# Altium project PI - Power.PrjPcb
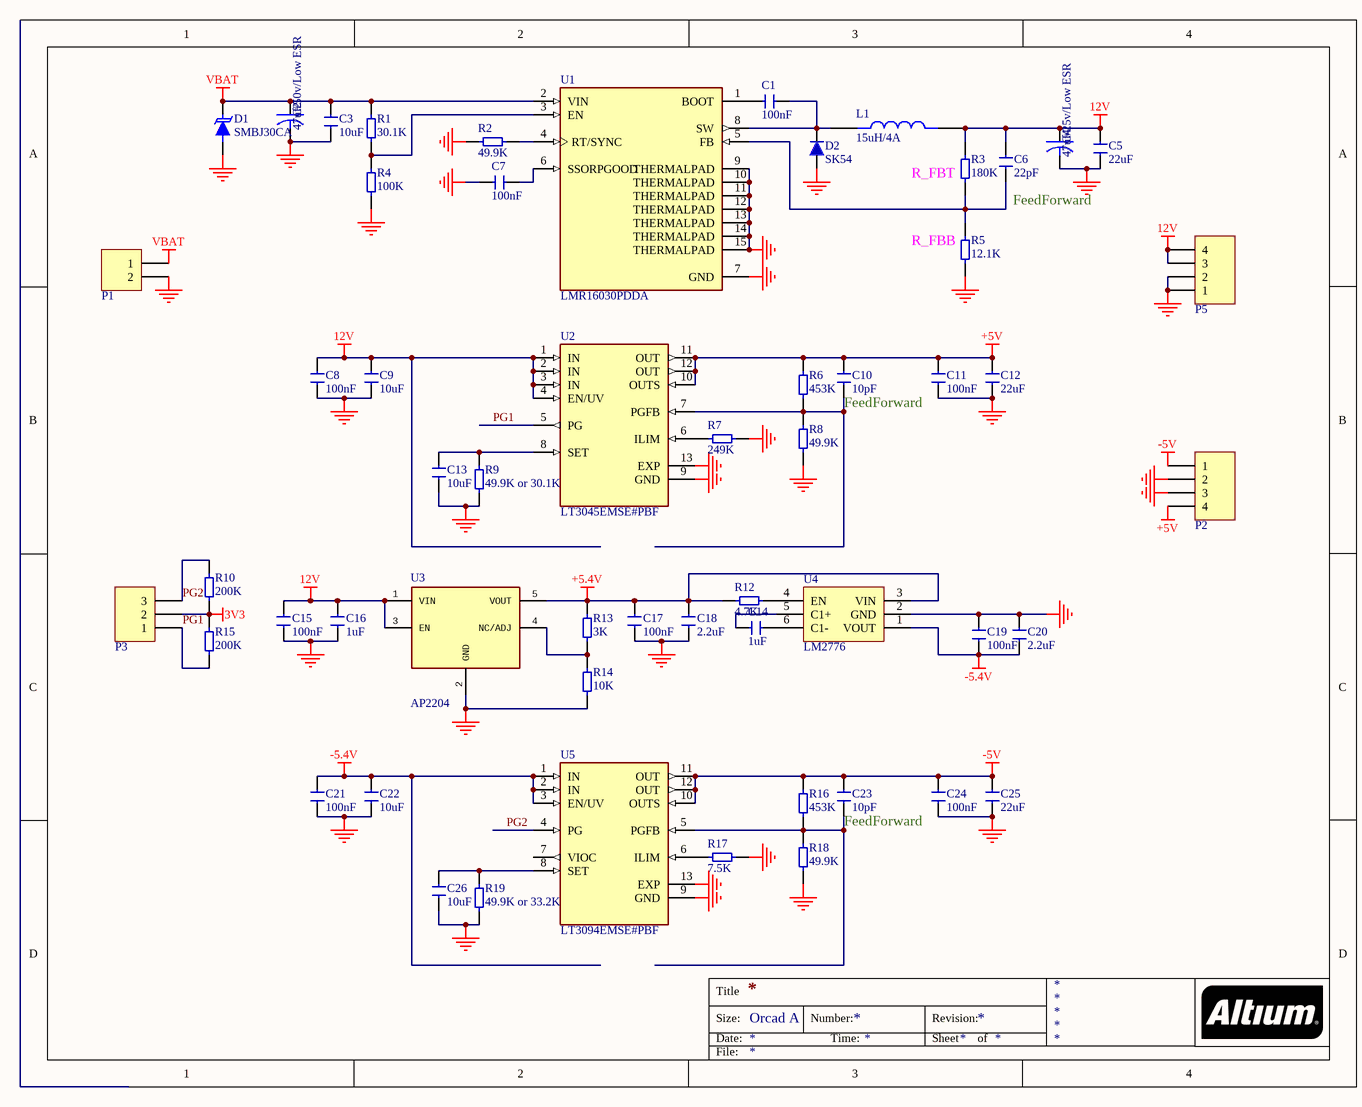
[diagram p0: Power2-5V.SchDoc]
1 sheet, 56 parts. Net scope: global (net labels, ports and power ports of the same name join across sheets).
Board file: PCB3+.PcbDoc

## Sheet Power2-5V.SchDoc
size OrCAD A

### Parts
C1  100nF  [0805 Capacitor]
C2  47uf/50v/Low ESR  [$CAP-RB-80MIL-D5MM]
C3  10uF  [1206 Capacitor]
C4  47uf/25v/Low ESR  [$CAP-RB-80MIL-D5MM]
C5  22uF  [1206 Capacitor]
C6  22pF  [0603 Capacitor]
C7  100nF  [0805 Capacitor]
C8  100nF  [0805 Capacitor]
C9  10uF  [1206 Capacitor]
C10  10pF  [0603 Capacitor]
C11  100nF  [0805 Capacitor]
C12  22uF  [1206 Capacitor]
C13  10uF  [1206 Capacitor]
C14  1uF  [1206 Capacitor]
C15  100nF  [0805 Capacitor]
C16  1uF  [1206 Capacitor]
C17  100nF  [0805 Capacitor]
C18  2.2uF  [1206 Capacitor]
C19  100nF  [0805 Capacitor]
C20  2.2uF  [1206 Capacitor]
C21  100nF  [0805 Capacitor]
C22  10uF  [1206 Capacitor]
C23  10pF  [0603 Capacitor]
C24  100nF  [0805 Capacitor]
C25  22uF  [1206 Capacitor]
C26  10uF  [1206 Capacitor]
D1  SMBJ30CA  [DO-214AC(SMA)]
D2  SK54  [DO-214AC(SMA)]
L1  15uH/4A  [IND_B82477R4103M100]
P1  J2  [$xh-2pin male-L]  (value not drawn)
P2  J4  [$xh-4pin male-L]  (value not drawn)
P3  J3  [$xh-3pin male-L]  (value not drawn)
P5  J4  [$xh-4pin male-L]  (value not drawn)
R1  30.1K  [0805 Resistor]
R2  49.9K  [0805 Resistor]
R3  180K  [0805 Resistor]
R4  100K  [0805 Resistor]
R5  12.1K  [0805 Resistor]
R6  453K  [0805 Resistor]
R7  249K  [0805 Resistor]
R8  49.9K  [0805 Resistor]
R9  49.9K or 30.1K  [0805 Resistor]
R10  200K  [0805 Resistor]
R12  4.7K  [0805 Resistor]
R13  3K  [0805 Resistor]
R14  10K  [0805 Resistor]
R15  200K  [0805 Resistor]
R16  453K  [0805 Resistor]
R17  7.5K  [0805 Resistor]
R18  49.9K  [0805 Resistor]
R19  49.9K or 33.2K  [0805 Resistor]
U1  LMR16030PDDA  [VREG_LMR16030PDDA]
U2  LT3045EMSE#PBF  [SOP65P490X110-13N]
U3  AP2204  [SOT23-5]
U4  LM2776  [SOT23-6]
U5  LT3094EMSE#PBF  [SOP65P490X110-13N]

### Nets
3V3: P3.2 R10.2 R15.1
12V: C4.1 C5.2 C6.1 C8.2 C9.2 C15.2 C16.2 L1.2 P5.3 P5.4 R3.1 U2.1(IN) U2.2(IN) U2.3(IN) U2.4(EN/UV) U3.1(VIN) U3.3(EN)
+5.4V: C17.2 C18.2 R12.1 R13.1 U3.5(VOUT) U4.3(VIN)
+5V: C10.1 C11.2 C12.2 P2.4 R6.1 U2.10(OUTS) U2.11(OUT) U2.12(OUT)
-5.4V: C19.1 C20.1 C21.2 C22.2 U4.1(VOUT) U5.1(IN) U5.2(IN) U5.3(EN/UV)
-5V: C23.1 C24.2 C25.2 P2.1 R16.1 U5.10(OUTS) U5.11(OUT) U5.12(OUT)
GND: C2.2 C3.1 C4.2 C5.1 C7.1 C8.1 C9.1 C11.1 C12.1 C13.1 C15.1 C16.1 C17.1 C18.1 C19.2 C20.2 C21.1 C22.1 C24.1 C25.1 C26.1 D1.1 D2.1(A) P1.2 P2.2 P2.3 P5.1 P5.2 R2.2 R4.1 R5.2 R7.2 R8.2 R9.2 R14.2 R17.2 R18.2 R19.2 U1.7(GND) U1.9(THERMALPAD) U1.10(THERMALPAD) U1.11(THERMALPAD) U1.12(THERMALPAD) U1.13(THERMALPAD) U1.14(THERMALPAD) U1.15(THERMALPAD) U2.9(GND) U2.13(EXP) U3.2(GND) U4.2(GND) U5.9(GND) U5.13(EXP)
VBAT: C2.1 C3.2 D1.2 P1.1 R1.2 U1.2(VIN)
PG1: P3.1 R15.2 U2.5(PG)
PG2: P3.3 R10.1 U5.4(PG)
NetC1_1: C1.1 U1.1(BOOT)
NetC1_2: C1.2 D2.2(K) L1.1 U1.8(SW)
NetC6_2: C6.2 R3.2 R5.1 U1.5(FB)
NetC7_2: C7.2 U1.6(SSORPGOOD)
NetC10_2: C10.2 R6.2 R8.1 U2.7(PGFB)
NetC13_2: C13.2 R9.1 U2.8(SET)
NetC14_1: C14.1 U4.6(C1-)
NetC14_2: C14.2 U4.5(C1+)
NetC23_2: C23.2 R16.2 R18.1 U5.5(PGFB)
NetC26_2: C26.2 R19.1 U5.8(SET)
NetR1_1: R1.1 R4.2 U1.3(EN)
NetR2_1: R2.1 U1.4(RT/SYNC)
NetR7_1: R7.1 U2.6(ILIM)
NetR12_2: R12.2 U4.4(EN)
NetR13_2: R13.2 R14.1 U3.4(NC/ADJ)
NetR17_1: R17.1 U5.6(ILIM)

Not connected (* = marked no-connect by the designer): U5 7(VIOC)

### Notes on the sheet
- (near R3) R_FBT
- FeedForward
- (near R5) R_FBB
- Title
- Size:
- Date:
- Orcad A
- Number:
- Time:
- Revision:
- Sheet
- of
- File:
- (in symbol Cap pol$) +

### Library data of the parts
C1 C3 C5-C26 = Capacitor SMD
  C1 C7 C8 C11 C15 C17 C19 C21 C24: Value: 100nF
  C3 C9 C13 C22 C26: Value: 10uF
  C5 C12 C25: Value: 22uF
  C6: Value: 22pF
  C10 C23: Value: 10pF
  C14 C16: Value: 1uF
  C18 C20: Value: 2.2uF
C2 C4 = Cap pol$: Device Code: 124112
D1 = SMBJ18A-13-F
D2 = 1N4001
L1 = B82477R4103M100: Inductor de Potencia SMD 10 ÂµH 6.2 A Â±20 % 12.5x12.5x8.5 Injection molded base shielded EPCOS / TDK; SnapEDA_Link: https://www.snapeda.com/parts/B82477R4103M100/EPCOS/view-part/?ref=snap; Package: NON STANDARD-2 EPCOS; Value: *; MF: EPCOS; MP: B82477R4103M100; Check_prices: https://www.snapeda.com/parts/B82477R4103M100/EPCOS/view-part/?ref=eda
P1 = Connector2$: Connector, 2Pin; Device Code: 1111111
P2 P5 = Connector4$: Connector, 4Pin; Device Code: 1111111
P3 = Connector3$: Connector, 3Pin; Device Code: 1111111
R1-R10 R12-R19 = Resistor SMD
  R1: Value: 30.1K
  R2 R8 R18: Value: 49.9K
  R3: Value: 180K
  R4: Value: 100K
  R5: Value: 12.1K
  R6 R16: Value: 453K
  R7: Value: 249K
  R9: Value: 49.9K or 30.1K
  R10 R15: Value: 200K
  R12: Value: 4.7K
  R13: Value: 3K
  R14: Value: 10K
  R17: Value: 7.5K
  R19: Value: 49.9K or 33.2K
U1 = LMR16030PDDA: SIMPLE SWITCHER 60V, 3A Step-Down Converter with 40uA Iq; MF: Texas Instruments; SnapEDA_Link: https://www.snapeda.com/parts/LMR16030PDDA/Texas+Instruments/view-part/?ref=snap; Package: HSOIC-8 Texas Instruments; Value: *; MP: LMR16030PDDA; Check_prices: https://www.snapeda.com/parts/LMR16030PDDA/Texas+Instruments/view-part/?ref=eda
U2 U5 = LT3045EMSE#PBF: 20V, 500mA, Ultralow Noise, Ultrahigh PSRR Linear Regulator; MF: Analog Devices; SnapEDA_Link: https://www.snapeda.com/parts/LT3045EMSE%23PBF/Analog+Devices/view-part/?ref=snap; Package: MSOP -12 Analog Devices; Value: *; MP: LT3045EMSE#PBF; Check_prices: https://www.snapeda.com/parts/LT3045EMSE%23PBF/Analog+Devices/view-part/?ref=eda
U3 = AP2112
U4 = Tps563200